# Altium project POD-Design-v1.1.PrjPcb (part 4 of 6)

## Sheet Motion-Temp-Sensor-Sheet.SchDoc
size 420 x 297 mm; SheetNumber: 6; SheetTotal: 11
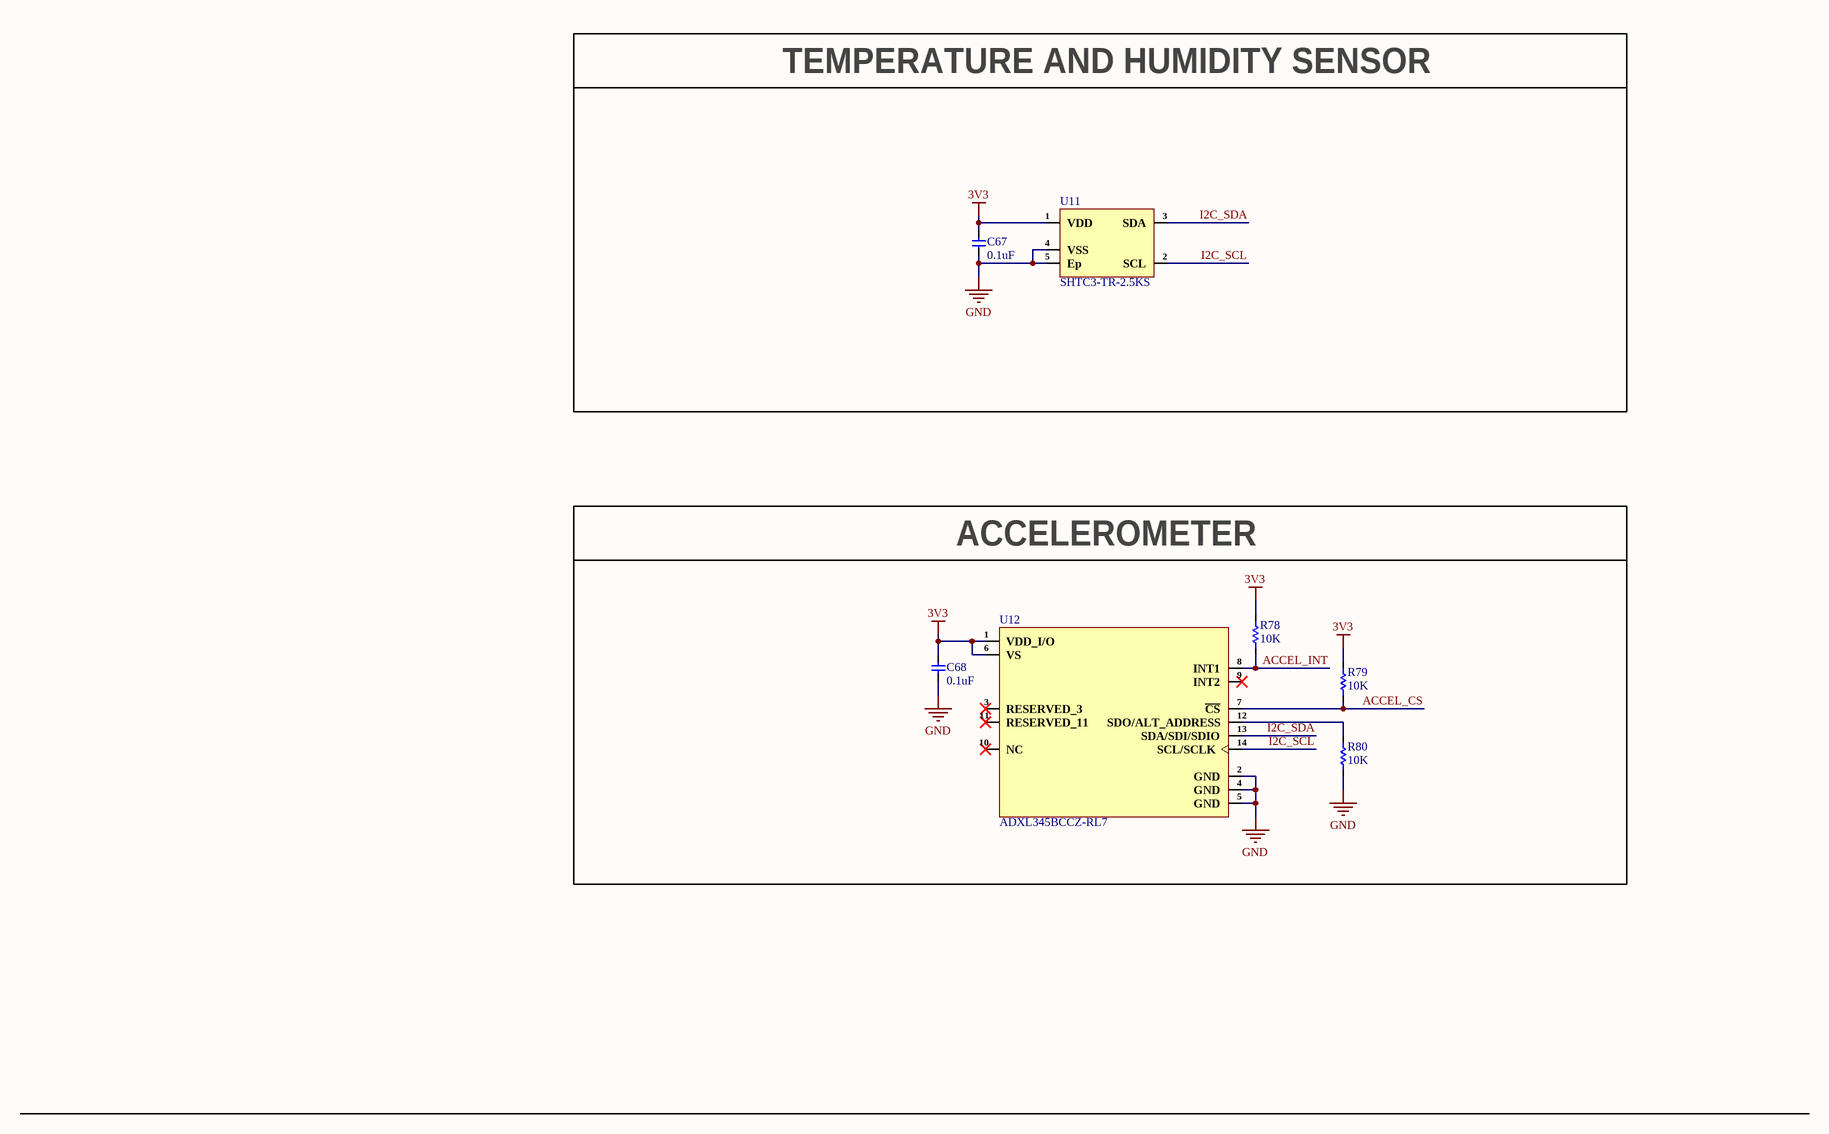
[diagram p5: Motion-Temp-Sensor-Sheet.SchDoc]

### Parts
C67  0.1uF  [Cap-0402]
C68  0.1uF  [Cap-0402]
R78  10K  [Res-0402]
R79  10K  [Res-0402]
R80  10K  [Res-0402]
U11  SHTC3-TR-2.5KS  [4-WDFN Exposed Pad]
U12  ADXL345BCCZ-RL7  [14-LGA (3x5)]

### Blocks framed on the sheet
TEMPERATURE AND HUMIDITY SENSOR: C67 U11
ACCELEROMETER: C68 R78-R80 U12

### Nets
3V3: C67.2 C68.1 R78.2 R79.2 U11.1(VDD) U12.1(VDD_I/O) U12.6(VS)
GND: C67.1 C68.2 R80.1 U11.4(VSS) U11.5(Ep) U12.2(GND) U12.4(GND) U12.5(GND)
ACCEL_CS: R79.1 U12.7(~{CS})
ACCEL_INT: R78.1 U12.8(INT1)
I2C_SCL: U11.2(SCL) U12.14(SCL/SCLK)
I2C_SDA: U11.3(SDA) U12.13(SDA/SDI/SDIO)
NetR80_2: R80.2 U12.12(SDO/ALT_ADDRESS)

Not connected (* = marked no-connect by the designer): U12 3(RESERVED_3)* 9(INT2)* 10(NC)* 11(RESERVED_11)*

### Notes on the sheet
- ZyntelliTech
- File:
- Title:
- Date:
- Page
- Num:
- Total:
- Drawn By: Huzaifa Ali

### Library data of the parts
C67 = CC0402KRX7R7BB104: CAP CER 0.1UF 16V X7R 0402; Manufacturer: Yageo; Item Type: Capacitors; Material: 4241ConductorMaterial; Tolerance: 10%; Value: 100nF; Temperature Coefficient: 30ppm/°C; Supplier: Future Electronics; LCSC Part Number: C60474; Manufacturer Part Number: CC0402KRX7R7BB104; RoHS: Yes; Stock: 22130000; Pricing: 10000=0.0021, 40000=0.002, 150000=0.0019, 250000=0.0019, 500000=0.0018 (USD); Mounting Technology: Surface Mount; Case/Package: 0402; Pins: 2; Case Code (Metric): 1005; Case Code (Imperial): 0402; Min Operating Temperature: -55°C; Max Operating Temperature: 125°C; Dielectric: X7R; Voltage Rating: 16V; Voltage Rating (DC): 16V; Packaging: Tape and Reel; Package Quantity: 1; Termination: SMD/SMT; Voltage: 16V; Series: CC; Voltage Rating (AC): 16V; Length: 1mm; Width: 0.02inch; Height: 0.5mm; Thickness: 0.022inch; Depth: 0.5mm; Radiation Hardening: No; RoHS Compliant: Yes; Reach SVHC Compliant: No; Halogen Free: 5694HalogenFree; Lead Free: 5697LeadFree; ComponentLink1URL: https://datasheet.ciiva.com/11788/0900766b80ce67ed-11788364.pdf?src-supplier=Rs; ComponentLink1Description: https://datasheet.ciiva.com/11788/0900766b80ce67ed-11788364.pdf?src-supplier=Rs; ComponentLink2URL: https://datasheet.ciiva.com/7978/1489800-7978111.pdf?src-supplier=Element14; ComponentLink2Description: https://datasheet.ciiva.com/7978/1489800-7978111.pdf?src-supplier=Element14; ComponentLink3URL: https://datasheet.ciiva.com/161/mlccorderingcode-161545.pdf?src-supplier=Digikey; ComponentLink3Description: https://datasheet.ciiva.com/161/mlccorderingcode-161545.pdf?src-supplier=Digikey; ComponentLink4URL: https://datasheet.ciiva.com/161/mlccorderingcode-161544.pdf?src-supplier=Digikey; ComponentLink4Description: https://datasheet.ciiva.com/161/mlccorderingcode-161544.pdf?src-supplier=Digikey; ComponentLink5URL: https://datasheet.ciiva.com/161/mlccorderingcode-161546.pdf?src-supplier=Digikey; ComponentLink5Description: https://datasheet.ciiva.com/161/mlccorderingcode-161546.pdf?src-supplier=Digikey; ComponentLink6URL: https://datasheet.ciiva.com/8033/1734573-8033661.pdf?src-supplier=Element14; ComponentLink6Description: https://datasheet.ciiva.com/8033/1734573-8033661.pdf?src-supplier=Element14; ComponentLink7URL: https://datasheet.ciiva.com/28450/1489800-28450335.pdf?src-supplier=Element14; ComponentLink7Description: https://datasheet.ciiva.com/28450/1489800-28450335.pdf?src-supplier=Element14; ComponentLink8URL: https://datasheet.ciiva.com/13395/upy-gphc-x7r-6-3v-to-50v-8-13395676.pdf?src-supplier=Mouser; ComponentLink8Description: https://datasheet.ciiva.com/13395/upy-gphc-x7r-6-3v-to-50v-8-13395676.pdf?src-supplier=Mouser; ComponentLink9URL: https://datasheet.ciiva.com/8033/1734573-8033663.pdf?src-supplier=Element14; ComponentLink9Description: https://datasheet.ciiva.com/8033/1734573-8033663.pdf?src-supplier=Element14; ComponentLink10URL: https://datasheet.ciiva.com/11587/upy-gphc-x7r-6-3v-to-50v-8-11587305.pdf?src-supplier=Avnet; ComponentLink10Description: https://datasheet.ciiva.com/11587/upy-gphc-x7r-6-3v-to-50v-8-11587305.pdf?src-supplier=Avnet
C68 = CC0402JRX7R7BB104: CAP CER 0.1UF 16V X7R 0402; Manufacturer: Yageo; Material: 4241ConductorMaterial; Value: 100nF; Tolerance: 5%; Item Type: Capacitor; Supplier: Digikey; Supplier Part Number: 311-1676-1-ND; Manufacturer Part Number: CC0402JRX7R7BB104; RoHS: Yes; Category: Ceramic Capacitors; Stock: 1659111; Pricing: 1=0.1, 10=0.046, 50=0.0262, 100=0.0203, 500=0.01528, 1000=0.012, 2500=0.01091, 5000=0.01004 (USD); Mounting Technology: Surface Mount; Case/Package: 0402; Case Code (Metric): 1005; Case Code (Imperial): 0402; Min Operating Temperature: -55°C; Max Operating Temperature: 125°C; Dielectric: X7R; Packaging: Tape and Reel; Package Quantity: 10000; Voltage Rating (DC): 16V; Voltage Rating: 16V; Series: CC; Construction: Flat; Length: 0.039inch; Width: 0.02inch; Height: 0.5mm; Thickness: 0.022inch; Lead Free: Lead Free; Halogen Free: Halogen Free; RoHS Compliant: Yes; ComponentLink1URL: https://datasheet.ciiva.com/13210/upy-gphc-x7r-6-3v-to-50v-8-12304-13210152.pdf?src-supplier=Mouser; ComponentLink1Description: https://datasheet.ciiva.com/13210/upy-gphc-x7r-6-3v-to-50v-8-12304-13210152.pdf?src-supplier=Mouser; LCSC Part Number: C541464
R78-R80 = RC0402FR-0710KL: RES 10K OHM 1% 1/16W 0402; Manufacturer: Yageo; Resistance: 10kR; Voltage Rating (DC): 50V; Temperature Coefficient: 100ppm/°C; Power Rating: 62.5mW; Max Power Dissipation: 63mW; Item Type: Resistor; Supplier 1: Mouser; Manufacturer Part Number: RC0402FR-0710KL; RoHS: Yes; Category: Chip SMD Resistors; Stock 1: 18648329; Pricing 1: 1=0.10000, 10=0.01400, 50=0.01400, 100=0.00500, 1000=0.00300, 10000=0.00200 (USD); Case/Package: 0402; Number of Pins: 2; Case Code (Imperial): 0402; Case Code (Metric): 1005; Min Operating Temperature: -55°C; Max Operating Temperature: 155°C; Resistor Type: Thick Film; Tolerance: 1%; Packaging: Tape and Reel; Voltage Rating: 50V; Termination: SMD/SMT; Working Voltage: 50V; Number of Terminations: 2; Features: Moisture Resistant; Series: RC; Resistance Tolerance: 1%; Construction: Rectangular; Length: 1mm; Width: 0.5mm; Height: 0.32mm; Depth: 0.5mm; Lead Pitch: 0.2mm; REACH SVHC: No SVHC; Lead Free: Lead Free; RoHS Compliant: Yes; Military Standard: Not; ComponentLink1URL: https://datasheet.ciiva.com/7660/38568-7660787.pdf?src-supplier=Element14; ComponentLink1Description: https://datasheet.ciiva.com/7660/38568-7660787.pdf?src-supplier=Element14; ComponentLink2URL: https://datasheet.ciiva.com/7849/1686128-7849814.pdf?src-supplier=Element14; ComponentLink2Description: https://datasheet.ciiva.com/7849/1686128-7849814.pdf?src-supplier=Element14; ComponentLink3URL: https://datasheet.ciiva.com/7983/1018594-7983486.pdf?src-supplier=Element14; ComponentLink3Description: https://datasheet.ciiva.com/7983/1018594-7983486.pdf?src-supplier=Element14; ComponentLink4URL: https://datasheet.ciiva.com/22747/1018594-22747512.pdf?src-supplier=Element14; ComponentLink4Description: https://datasheet.ciiva.com/22747/1018594-22747512.pdf?src-supplier=Element14; ComponentLink5URL: https://datasheet.ciiva.com/12667/pyu-rc0402-51-rohs-l-6-r-12667067.pdf?src-supplier=Mouser; ComponentLink5Description: https://datasheet.ciiva.com/12667/pyu-rc0402-51-rohs-l-6-r-12667067.pdf?src-supplier=Mouser; ComponentLink6URL: https://datasheet.ciiva.com/7849/1784430-7849813.pdf?src-supplier=Element14; ComponentLink6Description: https://datasheet.ciiva.com/7849/1784430-7849813.pdf?src-supplier=Element14; ComponentLink7URL: https://datasheet.ciiva.com/7849/1784430-7849815.pdf?src-supplier=Element14; ComponentLink7Description: https://datasheet.ciiva.com/7849/1784430-7849815.pdf?src-supplier=Element14; Supplier Part Number 1: 603-RC0402FR-0710KL; LCSC Part Number: C60490
U11 = SHTC3-TR-2.5KS: SHTC3 Series Digital ±2% RH SMT Humidity Temperature Sensor - DFN-8; Manufacturer: Sensirion; Item Type: IC; Supplier: Digikey; LCSC Part Number: C194656; Manufacturer Part Number: SHTC3-TR-2.5KS; RoHS: No; Stock: 21685; Pricing: 1=2.72, 5=2.292, 10=2.129, 25=1.932, 50=1.7952, 100=1.6682, 500=1.40712, 1000=1.30776 (USD); ComponentLink1URL: https://datasheet.octopart.com/SHTC3-TR-2.5KS-Sensirion-datasheet-166628637.pdf?src-supplier=Future+Electronics; ComponentLink1Description: https://datasheet.octopart.com/SHTC3-TR-2.5KS-Sensirion-datasheet-166628637.pdf?src-supplier=Future+Electronics
U12 = ADXL345BCCZ-RL7: ACCEL 2-16G I2C/SPI 14LGA; Manufacturer: Analog Devices; Item Type: Accelerometers; Supplier: Mouser; LCSC Part Number: C9667; Manufacturer Part Number: ADXL345BCCZ-RL7; RoHS: Yes; Stock: 17836; Pricing: 1=6.67, 10=5.76, 50=5.27, 100=5.09, 1000=4.59, 10000=4.59 (USD); ComponentLink1URL: https://datasheet.ciiva.com/15099/getdatasheetpartid-317342-15099703.pdf?src-supplier=Verical; ComponentLink1Description: https://datasheet.ciiva.com/15099/getdatasheetpartid-317342-15099703.pdf?src-supplier=Verical; ComponentLink2URL: https://datasheet.ciiva.com/3271/adxl345-ep-3271528.pdf?src-supplier=Avnet; ComponentLink2Description: https://datasheet.ciiva.com/3271/adxl345-ep-3271528.pdf?src-supplier=Avnet; ComponentLink3URL: https://datasheet.ciiva.com/2809/adxl345-2809853.pdf?src-supplier=Digikey; ComponentLink3Description: https://datasheet.ciiva.com/2809/adxl345-2809853.pdf?src-supplier=Digikey; ComponentLink4URL: https://datasheet.ciiva.com/2809/adxl345-2809854.pdf?src-supplier=Digikey; ComponentLink4Description: https://datasheet.ciiva.com/2809/adxl345-2809854.pdf?src-supplier=Digikey; ComponentLink5URL: https://datasheet.ciiva.com/2809/adxl345-2809855.pdf?src-supplier=Digikey; ComponentLink5Description: https://datasheet.ciiva.com/2809/adxl345-2809855.pdf?src-supplier=Digikey; ComponentLink6URL: https://datasheet.ciiva.com/3271/adxl345-ep-3271595.pdf?src-supplier=Avnet; ComponentLink6Description: https://datasheet.ciiva.com/3271/adxl345-ep-3271595.pdf?src-supplier=Avnet

## Sheet DC-Measurement-Sheet.SchDoc
size 420 x 297 mm; SheetNumber: 7; SheetTotal: 11
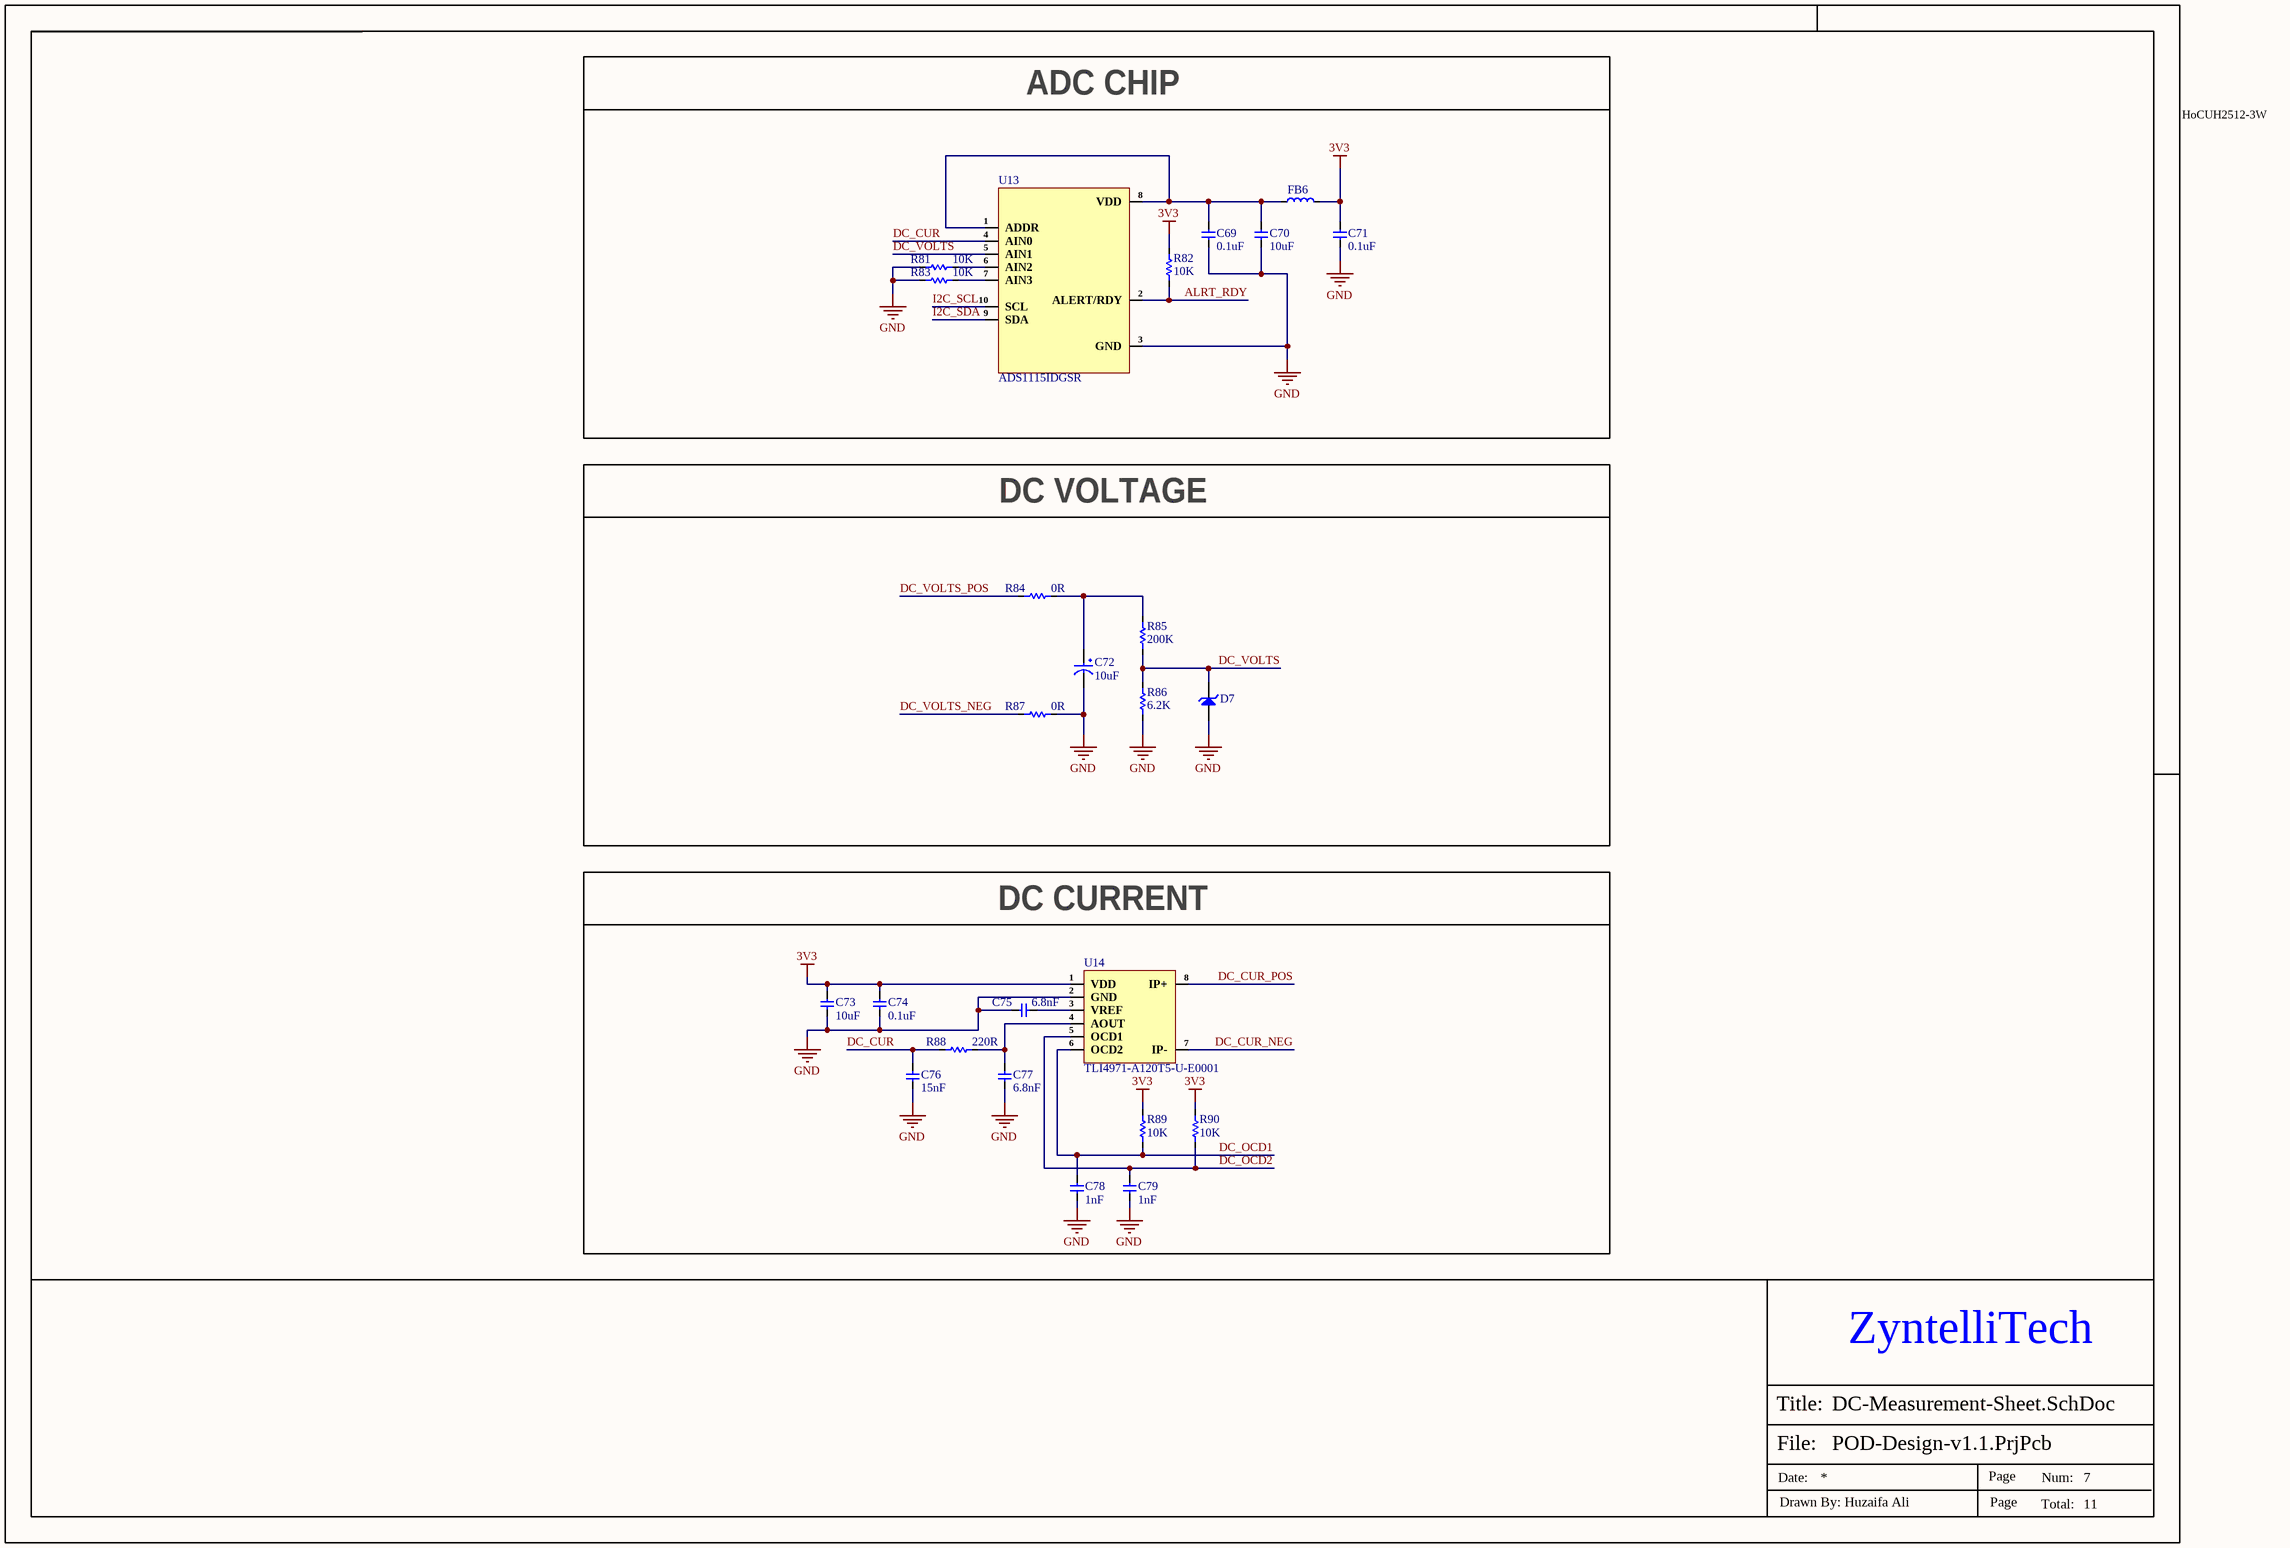
[diagram p6: DC-Measurement-Sheet.SchDoc]

### Parts
C69  0.1uF  [Cap-0402]
C70  10uF  [Cap-0603]
C71  0.1uF  [Cap-0402]
C72  10uF  [UD2C100M0810]
C73  10uF  [Cap-0603]
C74  0.1uF  [Cap-0603]
C75  6.8nF  [Cap-0603]
C76  15nF  [Cap-0603]
C77  6.8nF  [Cap-0603]
C78  1nF  [Cap-0402]
C79  1nF  [Cap-0402]
D7  MM3Z3V3B  [SOD323F]  (value not drawn)
FB6  MMZ2012R102ATD25  [Ind-0805]  (value not drawn)
R81  10K  [Res-0402]
R82  10K  [Res-0402]
R83  10K  [Res-0402]
R84  0R  [Res-0805]
R85  200K  [RES-2512]
R86  6.2K  [RES-2512]
R87  0R  [Res-0805]
R88  220R  [Res-0603]
R89  10K  [Res-0402]
R90  10K  [Res-0402]
U13  ADS1115IDGSR  [VSSOP-10]
U14  TLI4971-A120T5-U-E0001  [TISON-8(8x8)]

### Blocks framed on the sheet
ADC CHIP: C69-C71 FB6 R81-R83 U13
DC VOLTAGE: C72 D7 R84-R87
DC CURRENT: C73-C79 R88-R90 U14

### Nets
3V3: C71.2 C73.2 C74.2 FB6.2 R82.2 R89.1 R90.1 U14.1(VDD)
GND: C69.1 C70.1 C71.1 C72.2 C73.1 C74.1 C75.1 C76.1 C77.1 C78.1 C79.1 D7.1(A) R81.1 R83.1 R86.1 R87.2 U13.3(GND) U14.2(GND)
ALRT_RDY: R82.1 U13.2(ALERT/RDY)
DC_CUR: C76.2 R88.1 U13.4(AIN0)
DC_CUR_NEG: U14.7(IP-)
DC_CUR_POS: U14.8(IP+)
DC_OCD1: C78.2 R89.2 U14.6(OCD2)
DC_OCD2: C79.2 R90.2 U14.5(OCD1)
DC_VOLTS: D7.2(K) R85.1 R86.2 U13.5(AIN1)
DC_VOLTS_NEG: R87.1
DC_VOLTS_POS: R84.1
I2C_SCL: U13.10(SCL)
I2C_SDA: U13.9(SDA)
NetC69_2: C69.2 C70.2 FB6.1 U13.1(ADDR) U13.8(VDD)
NetC72_1: C72.1 R84.2 R85.2
NetC75_2: C75.2 U14.3(VREF)
NetC77_2: C77.2 R88.2 U14.4(AOUT)
NetR81_2: R81.2 U13.6(AIN2)
NetR83_2: R83.2 U13.7(AIN3)

### Notes on the sheet
- HoCUH2512-3W
- ZyntelliTech
- File:
- Title:
- Date:
- Page
- Num:
- Total:
- Drawn By: Huzaifa Ali

### Library data of the parts
C69 C71 = CC0402KRX7R7BB104: as C67 on sheet Motion-Temp-Sensor-Sheet; Supplier: Future Electronics; LCSC Part Number: C60474; Manufacturer Part Number: CC0402KRX7R7BB104; RoHS: Yes; Stock: 22130000; Pricing: 10000=0.0021, 40000=0.002, 150000=0.0019, 250000=0.0019, 500000=0.0018 (USD); Mounting Technology: Surface Mount; Case/Package: 0402; Pins: 2; Case Code (Metric): 1005; Case Code (Imperial): 0402; Min Operating Temperature: -55°C; Max Operating Temperature: 125°C; Dielectric: X7R; Voltage Rating: 16V; Voltage Rating (DC): 16V; Packaging: Tape and Reel; Package Quantity: 1; Termination: SMD/SMT; Voltage: 16V; Series: CC; Voltage Rating (AC): 16V; Length: 1mm; Width: 0.02inch; Height: 0.5mm; Thickness: 0.022inch; Depth: 0.5mm; Radiation Hardening: No; RoHS Compliant: Yes; Reach SVHC Compliant: No; Halogen Free: 5694HalogenFree; Lead Free: 5697LeadFree; ComponentLink1URL: https://datasheet.ciiva.com/11788/0900766b80ce67ed-11788364.pdf?src-supplier=Rs; ComponentLink1Description: https://datasheet.ciiva.com/11788/0900766b80ce67ed-11788364.pdf?src-supplier=Rs; ComponentLink2URL: https://datasheet.ciiva.com/7978/1489800-7978111.pdf?src-supplier=Element14; ComponentLink2Description: https://datasheet.ciiva.com/7978/1489800-7978111.pdf?src-supplier=Element14; ComponentLink3URL: https://datasheet.ciiva.com/161/mlccorderingcode-161545.pdf?src-supplier=Digikey; ComponentLink3Description: https://datasheet.ciiva.com/161/mlccorderingcode-161545.pdf?src-supplier=Digikey; ComponentLink4URL: https://datasheet.ciiva.com/161/mlccorderingcode-161544.pdf?src-supplier=Digikey; ComponentLink4Description: https://datasheet.ciiva.com/161/mlccorderingcode-161544.pdf?src-supplier=Digikey; ComponentLink5URL: https://datasheet.ciiva.com/161/mlccorderingcode-161546.pdf?src-supplier=Digikey; ComponentLink5Description: https://datasheet.ciiva.com/161/mlccorderingcode-161546.pdf?src-supplier=Digikey; ComponentLink6URL: https://datasheet.ciiva.com/8033/1734573-8033661.pdf?src-supplier=Element14; ComponentLink6Description: https://datasheet.ciiva.com/8033/1734573-8033661.pdf?src-supplier=Element14; ComponentLink7URL: https://datasheet.ciiva.com/28450/1489800-28450335.pdf?src-supplier=Element14; ComponentLink7Description: https://datasheet.ciiva.com/28450/1489800-28450335.pdf?src-supplier=Element14; ComponentLink8URL: https://datasheet.ciiva.com/13395/upy-gphc-x7r-6-3v-to-50v-8-13395676.pdf?src-supplier=Mouser; ComponentLink8Description: https://datasheet.ciiva.com/13395/upy-gphc-x7r-6-3v-to-50v-8-13395676.pdf?src-supplier=Mouser; ComponentLink9URL: https://datasheet.ciiva.com/8033/1734573-8033663.pdf?src-supplier=Element14; ComponentLink9Description: https://datasheet.ciiva.com/8033/1734573-8033663.pdf?src-supplier=Element14; ComponentLink10URL: https://datasheet.ciiva.com/11587/upy-gphc-x7r-6-3v-to-50v-8-11587305.pdf?src-supplier=Avnet; ComponentLink10Description: https://datasheet.ciiva.com/11587/upy-gphc-x7r-6-3v-to-50v-8-11587305.pdf?src-supplier=Avnet
C70 C73 = GRM188Z71A106KA73D: CAP CER 10UF 10V X7R 0603; Manufacturer: Murata; Item Type: Capacitor; Material: 4241ConductorMaterial; Tolerance: 10%; Supplier: Mouser; LCSC Part Number: C2959727; Manufacturer Part Number: GRM188Z71A106KA73D; RoHS: Yes; Stock: 390983; Pricing: 1=0.36, 10=0.155, 50=0.155, 100=0.104, 1000=0.094, 10000=0.065 (USD); Case/Package: 345Case; Min Operating Temperature: -55°C; Max Operating Temperature: 125°C; Value: 10uF; Voltage Rating: 10V; Length: 1.6mm; Width: 800um; Height: 1mm; Thickness: 800um; RoHS Compliant: Yes; ComponentLink1URL: https://datasheet.octopart.com/GRM188Z71A106KA73D-Murata-datasheet-165579666.pdf?src-supplier=TME; ComponentLink1Description: https://datasheet.octopart.com/GRM188Z71A106KA73D-Murata-datasheet-165579666.pdf?src-supplier=TME
C72 = UD2C100M0810: 10uF 160V ±20% SMD,D8xL10.2mm Aluminum Electrolytic Capacitors - SMD ROHS; Manufacturer: Honor Elec; Manufacturer Part Number: UD2C100M0810; Package: SMD,D8xL10.2mm; LCSC Part Number: C88696; Item Type: Capacitor; ComponentLink1Description: LCSC; ComponentLink1URL: https://www.lcsc.com/product-detail/Aluminum-Electrolytic-Capacitors-SMD_Honor-Elec-UD2C100M0810_C88696.html
C74 = CC0603JRX7R9BB104: CAP CER 0.1UF 50V X7R 0603; Manufacturer: Yageo; Item Type: Capacitors; Material: 4241ConductorMaterial; Supplier: Future Electronics; LCSC Part Number: C91183; Manufacturer Part Number: CC0603JRX7R9BB104; RoHS: Yes; Stock: 204000; Pricing: 4000=0.0077, 16000=0.0073, 60000=0.007, 160000=0.0068, 400000=0.0064 (USD); Pins: 2NUMBER; Halogen Free: 5694HalogenFree; Lead Free: 5697LeadFree; ComponentLink1URL: https://datasheet.ciiva.com/11465/upy-gphc-x7r-6-3v-to-50v-8-11465038.pdf?src-supplier=Avnet; ComponentLink1Description: https://datasheet.ciiva.com/11465/upy-gphc-x7r-6-3v-to-50v-8-11465038.pdf?src-supplier=Avnet
C75 C77 = 0603B682K500NT: 50V 6.8nF X7R ±10% 0603; Manufacturer: FH; Item Type: Capacitor; ComponentLink1Description: LCSC; ComponentLink1URL: https://www.lcsc.com/product-detail/Multilayer-Ceramic-Capacitors-MLCC-SMD-SMT_FH-Guangdong-Fenghua-Advanced-Tech-0603B682K500NT_C1631.html; Manufacturer Part Number: 0603B682K500NT; Value: 6.8nF; LCSC Part Number: C1631; Footprint: 0603
C76 = CC0603JRX7R9BB153: CAP CER 0.015UF 50V X7R 0603; Manufacturer: Yageo; Tolerance: 5%; Item Type: Capacitor; Supplier 1: Future Electronics; Manufacturer Part Number: CC0603JRX7R9BB153; RoHS: Yes; Category: Ceramic Capacitors; Stock 1: 16000; Pricing 1: 4000=0.00980, 16000=0.00930, 60000=0.00890, 100000=0.00870, 200000=0.00820 (USD); Mounting Technology: Surface Mount; Case/Package: 0603; Case Code (Imperial): 0603; Case Code (Metric): 1608; Weight: 7.1E-05oz; Min Operating Temperature: -55°C; Max Operating Temperature: 125°C; Value: 15nF; Dielectric: X7R; Voltage Rating: 50V; Voltage Rating (DC): 50V; Packaging: Tape and Reel; Termination: SMD/SMT; Resistor Type: Ceramic; Series: CC; Construction: Flat; Length: 1.6mm; Width: 0.031inch; Height: 0.8mm; Thickness: 0.035inch; Depth: 0.8mm; Radiation Hardening: No; Lead Free: Lead Free; Halogen Free: Halogen Free; RoHS Compliant: Yes; ComponentLink1URL: http://www.mouser.com/ds/2/447/Yageo_UPY-GP_NP0_16V-to-50V_9-358835.pdf?src-supplier=Mouser; ComponentLink1Description: http://www.mouser.com/ds/2/447/Yageo_UPY-GP_NP0_16V-to-50V_9-358835.pdf?src-supplier=Mouser; ComponentLink2URL: https://www.yageo.com/upload/media/product/productsearch/datasheet/mlcc/UPY-GPHC_X7R_6.3V-to-50V_18.pdf?src-supplier=Digi-Key; ComponentLink2Description: https://www.yageo.com/upload/media/product/productsearch/datasheet/mlcc/UPY-GPHC_X7R_6.3V-to-50V_18.pdf?src-supplier=Digi-Key; ComponentLink3URL: http://www.yageo.com/documents/recent/UPY-GPHC_X7R_6.3V-to-50V_8.pdf?src-supplier=Avnet; ComponentLink3Description: http://www.yageo.com/documents/recent/UPY-GPHC_X7R_6.3V-to-50V_8.pdf?src-supplier=Avnet; ComponentLink4URL: http://www.yageo.com/documents/recent/UPY-GPHC_X7R_6.3V-to-50V_9.pdf?src-supplier=Future+Electronics; ComponentLink4Description: http://www.yageo.com/documents/recent/UPY-GPHC_X7R_6.3V-to-50V_9.pdf?src-supplier=Future+Electronics; ComponentLink5URL: http://www.yageo.com/documents/recent/UPY-GPHC_X7R_6.3V-to-50V_16.pdf?src-supplier=Digi-Key; ComponentLink5Description: http://www.yageo.com/documents/recent/UPY-GPHC_X7R_6.3V-to-50V_16.pdf?src-supplier=Digi-Key; Supplier Part Number 1: 8958167; LCSC Part Number: C519550
C78 C79 = CC0402KRX7R8BB102: CAP CER 1000PF 25V X7R 0402; Manufacturer: Yageo; Tolerance: 10%; Dissipation Factor: 2.5%; Insulation Resistance: 10GR; Item Type: Capacitor; Supplier 1: Arrow Electronics; Manufacturer Part Number: CC0402KRX7R8BB102; RoHS: Yes; Category: Ceramic Capacitors; Stock 1: 370000; Pricing 1: 1=0.00230, 10000=0.00230, 100001=0.00190 (USD); Mount: Surface Mount; Case/Package: 0402; Number of Pins: 2; Case Code (Imperial): 0402; Case Code (Metric): 1005; Min Operating Temperature: -55°C; Max Operating Temperature: 125°C; Capacitance: 1nF; Packaging: Tape and Reel; Voltage Rating: 25V; Dielectric: X7R; Termination: SMD/SMT; Voltage Rating (DC): 25V; Series: CC; Length: 1mm; Width: 0.02inch; Thickness: 0.022inch; Depth: 0.5mm; Radiation Hardening: No; Lead Free: Lead Free; Halogen Free: Halogen Free; RoHS Compliant: Yes; ComponentLink1URL: https://datasheet.ciiva.com/26862/getdatasheetpartid-639817-26862638.pdf?src-supplier=Verical; ComponentLink1Description: https://datasheet.ciiva.com/26862/getdatasheetpartid-639817-26862638.pdf?src-supplier=Verical; ComponentLink2URL: https://datasheet.ciiva.com/5425/upy-gp-np0-16v-to-50v-8-3714-5425527.pdf?src-supplier=Mouser; ComponentLink2Description: https://datasheet.ciiva.com/5425/upy-gp-np0-16v-to-50v-8-3714-5425527.pdf?src-supplier=Mouser; Supplier Part Number 1: CC0402KRX7R8BB102; LCSC Part Number: C541372
D7 = MM3Z3V3B: DIODE ZENER 3.3V 200MW SOD323F; Manufacturer: ON Semiconductor / Fairchild; Forward Voltage: 1V; Tolerance: 2%; Impedance: 89R; Max Reverse Leakage Current: 4.5uA; Test Current: 5mA; Element Configuration: Single; Supplier 1: Digi-Key; Manufacturer Part Number: MM3Z3V3B; Stock 1: 473644; Pricing 1: 1=0.22, 10=0.18, 100=0.0956, 500=0.06288, 1000=0.04276 (USD); Mount: Surface Mount; Number of Pins: 2; Weight: 0.0276g; Min Operating Temperature: -65°C; Max Operating Temperature: 150°C; Packaging: Tape and Reel; Package Quantity: 1; Max Power Dissipation: 200mW; Zener Voltage: 3.3V; Voltage Tolerance: 2%; Power Dissipation: 200mW; Working Voltage: 3.3V; Peak Reverse Current: 4.5uA; Length: 1.3mm; Height: 1mm; Width: 1.7mm; Radiation Hardening: No; REACH SVHC: No SVHC; Lead Free: Lead Free; ComponentLink1URL: http://www.onsemi.com/pub/Collateral/MM3Z9V1B-D.pdf?src-supplier=Digi-Key; ComponentLink1Description: http://www.onsemi.com/pub/Collateral/MM3Z9V1B-D.pdf?src-supplier=Digi-Key; ComponentLink2URL: http://www.mouser.com/ds/2/149/MM3Z3V3B-187166.pdf?src-supplier=Mouser; ComponentLink2Description: http://www.mouser.com/ds/2/149/MM3Z3V3B-187166.pdf?src-supplier=Mouser; ComponentLink3URL: https://www.fairchildsemi.com/datasheets/MM/MM3Z9V1B.pdf?src-supplier=Avnet; ComponentLink3Description: https://www.fairchildsemi.com/datasheets/MM/MM3Z9V1B.pdf?src-supplier=Avnet; ComponentLink4URL: http://www.farnell.com/datasheets/1706525.pdf?src-supplier=Element14; ComponentLink4Description: http://www.farnell.com/datasheets/1706525.pdf?src-supplier=Element14; Supplier Part Number 1: MM3Z3V3BCT-ND; LCSC Part Number: C2978865; Item Type: Diode
FB6 = MMZ2012R102ATD25: FERRITE BEAD 1K OHM 0805 1LN; Manufacturer: TDK; Number of Lines: 1; Max Current Rating: 500mA; DC Resistance (DCR): 300mR; Impedance: 1kR; Tolerance: 25%; Test Frequency: 100MHz; Supplier 1: Digi-Key; Manufacturer Part Number: MMZ2012R102ATD25; RoHS: Yes; Category: Ferrite Beads and Chips; Stock 1: 2942; Pricing 1: 1=0.11000, 10=0.09200, 25=0.08280, 50=0.06080, 100=0.05240, 250=0.04140, 500=0.03496, 1000=0.02944 (USD); Mount: Surface Mount; Case/Package: 0805; Case Code (Metric): 2012; Case Code (Imperial): 0805; Weight: 0.000194oz; Min Operating Temperature: -55°C; Max Operating Temperature: 125°C; Package Quantity: 4000; Packaging: Tape and Reel; Termination: SMD/SMT; Max DC Current: 500mA; Length: 0.079inch; Width: 0.049inch; Height: 0.041inch; Ratings: AEC-Q200; RoHS Compliant: Yes; ComponentLink1URL: http://www.mouser.com/ds/2/400/beads_automotive_signal_mmz_en-469244.pdf?src-supplier=Mouser; ComponentLink1Description: http://www.mouser.com/ds/2/400/beads_automotive_signal_mmz_en-469244.pdf?src-supplier=Mouser; ComponentLink2URL: https://product.tdk.com/info/en/catalog/datasheets/beads_automotive_signal_mmz2012_en.pdf?src-supplier=Digi-Key; ComponentLink2Description: https://product.tdk.com/info/en/catalog/datasheets/beads_automotive_signal_mmz2012_en.pdf?src-supplier=Digi-Key; Supplier Part Number 1: 445-MMZ2012R102ATD25CT-ND; LCSC Part Number: C307765; Item Type: Ferrite Bead
R81-R83 = RC0402FR-0710KL: as R78 on sheet Motion-Temp-Sensor-Sheet; Supplier 1: Mouser; Manufacturer Part Number: RC0402FR-0710KL; RoHS: Yes; Category: Chip SMD Resistors; Stock 1: 18648329; Pricing 1: 1=0.10000, 10=0.01400, 50=0.01400, 100=0.00500, 1000=0.00300, 10000=0.00200 (USD); Case/Package: 0402; Number of Pins: 2; Case Code (Imperial): 0402; Case Code (Metric): 1005; Min Operating Temperature: -55°C; Max Operating Temperature: 155°C; Resistor Type: Thick Film; Tolerance: 1%; Packaging: Tape and Reel; Voltage Rating: 50V; Termination: SMD/SMT; Working Voltage: 50V; Number of Terminations: 2; Features: Moisture Resistant; Series: RC; Resistance Tolerance: 1%; Construction: Rectangular; Length: 1mm; Width: 0.5mm; Height: 0.32mm; Depth: 0.5mm; Lead Pitch: 0.2mm; REACH SVHC: No SVHC; Lead Free: Lead Free; RoHS Compliant: Yes; Military Standard: Not; ComponentLink1URL: https://datasheet.ciiva.com/7660/38568-7660787.pdf?src-supplier=Element14; ComponentLink1Description: https://datasheet.ciiva.com/7660/38568-7660787.pdf?src-supplier=Element14; ComponentLink2URL: https://datasheet.ciiva.com/7849/1686128-7849814.pdf?src-supplier=Element14; ComponentLink2Description: https://datasheet.ciiva.com/7849/1686128-7849814.pdf?src-supplier=Element14; ComponentLink3URL: https://datasheet.ciiva.com/7983/1018594-7983486.pdf?src-supplier=Element14; ComponentLink3Description: https://datasheet.ciiva.com/7983/1018594-7983486.pdf?src-supplier=Element14; ComponentLink4URL: https://datasheet.ciiva.com/22747/1018594-22747512.pdf?src-supplier=Element14; ComponentLink4Description: https://datasheet.ciiva.com/22747/1018594-22747512.pdf?src-supplier=Element14; ComponentLink5URL: https://datasheet.ciiva.com/12667/pyu-rc0402-51-rohs-l-6-r-12667067.pdf?src-supplier=Mouser; ComponentLink5Description: https://datasheet.ciiva.com/12667/pyu-rc0402-51-rohs-l-6-r-12667067.pdf?src-supplier=Mouser; ComponentLink6URL: https://datasheet.ciiva.com/7849/1784430-7849813.pdf?src-supplier=Element14; ComponentLink6Description: https://datasheet.ciiva.com/7849/1784430-7849813.pdf?src-supplier=Element14; ComponentLink7URL: https://datasheet.ciiva.com/7849/1784430-7849815.pdf?src-supplier=Element14; ComponentLink7Description: https://datasheet.ciiva.com/7849/1784430-7849815.pdf?src-supplier=Element14; Supplier Part Number 1: 603-RC0402FR-0710KL; LCSC Part Number: C60490
R84 R87 = RC0805FR-070RL: RES 0 OHM JUMPER 1/8W 0805; Manufacturer: Yageo; Resistance: 0mR; Tolerance: 1%; Power Rating: 125mW; Item Type: Resistor; Supplier 1: Avnet; Manufacturer Part Number: RC0805FR-070RL; RoHS: Yes; Category: Chip SMD Resistors; Stock 1: 85000; Pricing 1: 5000=0.00281, 10000=0.00277, 20000=0.00269 (USD); Case/Package: 0805; Contact Plating: Tin,Matte; Case Code (Imperial): 0805; Case Code (Metric): 2012; Size Code: 0805; Min Operating Temperature: -55°C; Max Operating Temperature: 155°C; Resistor Type: Thick Film; Packaging: Tape and Reel; Features: Moisture Resistant; Series: RC; Max Power Dissipation: 125mW; Number of Terminations: 2; Construction: Rectangular; Length: 2mm; Depth: 1.25mm; Radiation Hardening: No; Military Standard: Not; Lead Free: Lead Free; RoHS Compliant: Yes; ComponentLink1URL: https://datasheet.ciiva.com/15189/getdatasheetpartid-348154-15189885.pdf?src-supplier=Verical; ComponentLink1Description: https://datasheet.ciiva.com/15189/getdatasheetpartid-348154-15189885.pdf?src-supplier=Verical; ComponentLink2URL: https://datasheet.ciiva.com/17042/rc0805-17042698.pdf?src-supplier=Future+Electronics; ComponentLink2Description: https://datasheet.ciiva.com/17042/rc0805-17042698.pdf?src-supplier=Future+Electronics; Supplier Part Number 1: RC0805FR-070RL; LCSC Part Number: C100045
R85 = HoCUH2512-3W-200KR-1%: 3W ±1% 200kΩ 2512 Chip Resistor - Surface Mount ROHS; Manufacturer: Milliohm; Manufacturer Part Number: HoCUH2512-3W-200KR-1%; Package: 2512; ComponentLink1Description: LCSC; ComponentLink1URL: https://www.lcsc.com/product-detail/Chip-Resistor-Surface-Mount_Milliohm-HoCUH2512-3W-200KR-1_C5123645.html; LCSC Part Number: C5123645; Item Type: Resistor
R86 = RC2512JK-7W6K2L: RES 6.2K OHM 5% 2W 2512; Manufacturer: Yageo; Item Type: Resistors; Supplier: Digikey; LCSC Part Number: C136991; Manufacturer Part Number: RC2512JK-7W6K2L; RoHS: Yes; Pricing: 4000=0.07843 (USD)
R88 = RC0603FR-07220RL: RES SMD 220 OHM 1% 1/10W 0603; Manufacturer: Yageo; Temperature Coefficient: 100ppm/°C; Voltage Rating (DC): 50V; Power Rating: 100mW; Item Type: Resistor; Supplier 1: Digi-Key; Manufacturer Part Number: RC0603FR-07220RL; Stock 1: 5843995; Pricing 1: 1=0.1, 10=0.023, 100=0.0094, 1000=0.00421, 2500=0.00366 (USD); Case/Package: 0603; Number of Pins: 2; Case Code (Imperial): 0603; Case Code (Metric): 1608; Min Operating Temperature: -55°C; Max Operating Temperature: 155°C; Resistance: 220R; Tolerance: 1%; Composition: Thick Film; Packaging: Tape and Reel; Voltage Rating: 50V; Package Quantity: 1; Termination: SMD/SMT; Number of Terminations: 2; Military Standard: Not; Max Power Dissipation: 100mW; Features: Moisture Resistant; Length: 1.6mm; Height: 0.022inch; Width: 0.031inch; Depth: 0.8mm; REACH SVHC: No SVHC; Lead Free: Lead Free; ComponentLink1URL: http://www.yageo.com/documents/recent/PYu-RC_Group_51_RoHS_L_10.pdf?src-supplier=Digi-Key; ComponentLink1Description: http://www.yageo.com/documents/recent/PYu-RC_Group_51_RoHS_L_10.pdf?src-supplier=Digi-Key; ComponentLink2URL: http://www.farnell.com/datasheets/1868787.pdf?src-supplier=Element14; ComponentLink2Description: http://www.farnell.com/datasheets/1868787.pdf?src-supplier=Element14; Supplier Part Number 1: 311-220HRCT-ND; LCSC Part Number: C107696
R89 R90 = RC0402FR-0710KL: RES 10K OHM 1% 1/16W 0402; Manufacturer: Yageo; Temperature Coefficient: 100ppm/°C; Working Voltage: 50V; Item Type: Resistor; Resistance: 10kR; Power Rating: 62.5mW; Max Power Dissipation: 63mW; Supplier 1: Mouser; Manufacturer Part Number: RC0402FR-0710KL; RoHS: Yes; Category: Chip SMD Resistors; Stock 1: 18648329; Pricing 1: 1=0.10000, 10=0.01400, 50=0.01400, 100=0.00500, 1000=0.00300, 10000=0.00200 (USD); Case/Package: 0402; Min Operating Temperature: -55°C; Max Operating Temperature: 155°C; Tolerance: 1%; Resistor Type: Thick Film; Construction: Rectangular; Packaging: Tape and Reel; Termination: SMD/SMT; RoHS Compliant: Yes; ComponentLink1URL: https://datasheet.ciiva.com/7660/38568-7660787.pdf?src-supplier=Element14; ComponentLink1Description: https://datasheet.ciiva.com/7660/38568-7660787.pdf?src-supplier=Element14; ComponentLink2URL: https://datasheet.ciiva.com/7849/1686128-7849814.pdf?src-supplier=Element14; ComponentLink2Description: https://datasheet.ciiva.com/7849/1686128-7849814.pdf?src-supplier=Element14; ComponentLink3URL: https://datasheet.ciiva.com/7983/1018594-7983486.pdf?src-supplier=Element14; ComponentLink3Description: https://datasheet.ciiva.com/7983/1018594-7983486.pdf?src-supplier=Element14; Supplier Part Number 1: 603-RC0402FR-0710KL; LCSC Part Number: C60490; Number of Pins: 2; Case Code (Imperial): 0402; Case Code (Metric): 1005; Voltage Rating (DC): 50V; Voltage Rating: 50V; Number of Terminations: 2; Features: Moisture Resistant; Series: RC; Resistance Tolerance: 1%; Length: 1mm; Width: 0.5mm; Height: 0.32mm; Depth: 0.5mm; Lead Pitch: 0.2mm; REACH SVHC: No SVHC; Lead Free: Lead Free; Military Standard: Not; ComponentLink4URL: https://datasheet.ciiva.com/22747/1018594-22747512.pdf?src-supplier=Element14; ComponentLink4Description: https://datasheet.ciiva.com/22747/1018594-22747512.pdf?src-supplier=Element14; ComponentLink5URL: https://datasheet.ciiva.com/12667/pyu-rc0402-51-rohs-l-6-r-12667067.pdf?src-supplier=Mouser; ComponentLink5Description: https://datasheet.ciiva.com/12667/pyu-rc0402-51-rohs-l-6-r-12667067.pdf?src-supplier=Mouser; ComponentLink6URL: https://datasheet.ciiva.com/7849/1784430-7849813.pdf?src-supplier=Element14; ComponentLink6Description: https://datasheet.ciiva.com/7849/1784430-7849813.pdf?src-supplier=Element14; ComponentLink7URL: https://datasheet.ciiva.com/7849/1784430-7849815.pdf?src-supplier=Element14; ComponentLink7Description: https://datasheet.ciiva.com/7849/1784430-7849815.pdf?src-supplier=Element14
U13 = ADS1115IDGSR: IC ADC 16BIT SIGMA-DELTA 10VSSOP; Manufacturer: Texas Instruments; Interface: I2C; Number of Bits: 16; Sampling Rate: 860S/s; Number of A/D Converters: 1; Resolution: 16b; Polarity: Bipolar; Min Supply Voltage: 2V; Max Supply Voltage: 5.5V; Supply Type: Single; Conversion Rate: 0.86KS/s; Number of Inputs: 4; Integral Nonlinearity (INL): 1LSB; Power Dissipation: 900uW; Nominal Supply Current: 150uA; Number of Channels: 2; Supplier: Mouser; Supplier Part Number: 595-ADS1115IDGSR; Manufacturer Part Number: ADS1115IDGSR; RoHS: Yes; Category: Analog to Digital Converters (ADCs); Stock: 5925; Pricing: 1=5.44, 10=4.76, 50=4.76, 100=4.01, 1000=2.88, 10000=2.78 (USD); Case/Package: VSSOP; Pins: 10; Contact Plating: Gold; Min Operating Temperature: -40°C; Max Operating Temperature: 125°C; Package Quantity: 2500; Packaging: Tape and Reel; Number of Converters: 1; Max Supply Voltage (DC): 5.5V; Min Supply Voltage (DC): 2V; Series: -; Length: 3mm; Width: 3mm; Height: 1.07mm; Thickness: 1.02mm; Reach SVHC Compliant: No; Lead Free: Lead Free; RoHS Compliant: Yes; ComponentLink1URL: https://datasheet.ciiva.com/4031/47725463s8438921n7713-4031028.pdf?src-supplier=Arrow+Electronics; ComponentLink1Description: https://datasheet.ciiva.com/4031/47725463s8438921n7713-4031028.pdf?src-supplier=Arrow+Electronics; LCSC Part Number: C37593; Item Type: IC
U14 = TLI4971-A120T5-U-E0001: POSITION&CURRENT SENSORS; Manufacturer: Infineon; Accuracy: 2.25%; Max Supply Voltage: 3.5V; Min Supply Voltage: 3.1V; Operating Supply Current: 15mA; Sensing Method: 6244SensingMethod; Supplier: Arrow Electronics; LCSC Part Number: C540236; Manufacturer Part Number: TLI4971-A120T5-U-E0001; RoHS: Yes; Item Type: Current Sensors; Stock: 5000; Pricing: 2500=2.753 (USD); Height: 1.1mm

## Sheet Connector-Sheet.SchDoc
size 420 x 297 mm; SheetNumber: 8; SheetTotal: 9
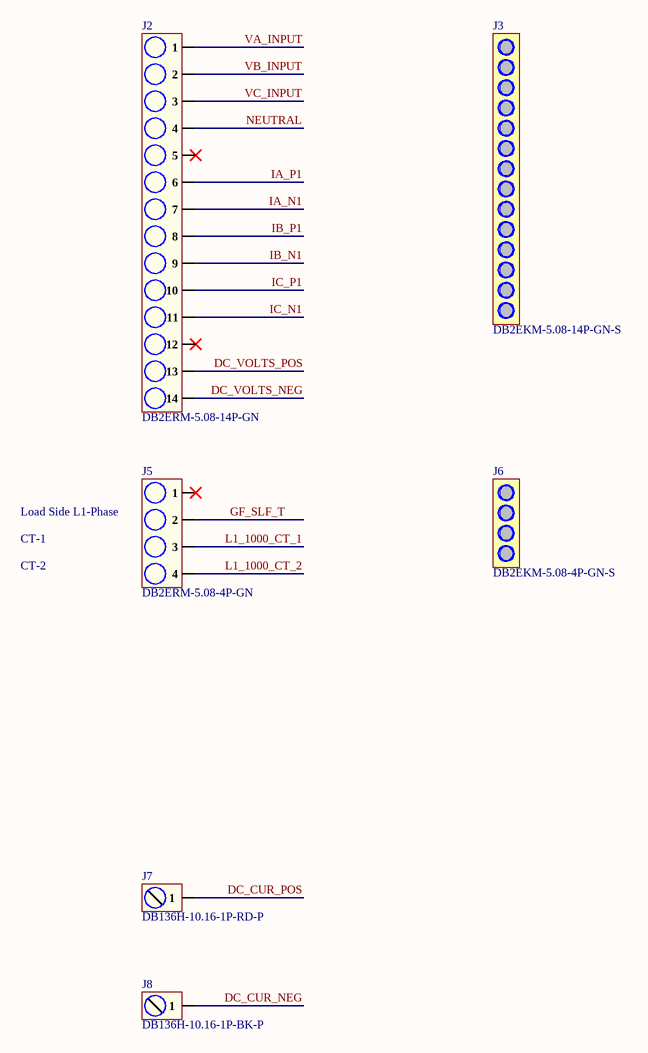
[diagram p7: Connector-Sheet.SchDoc]

### Parts
J2  DB2ERM-5.08-14P-GN  [DB2ERM-5.08-14P-GN]
J3  DB2EKM-5.08-14P-GN-S  (mechanical)
J5  DB2ERM-5.08-4P-GN  [DB2ERM-5.08-4P-GN]
J6  DB2EKM-5.08-4P-GN-S  (mechanical)
J7  DB136H-10.16-1P-RD-P  [DB136H-10.16-1P-RD-P]
J8  DB136H-10.16-1P-BK-P  [DB136H-10.16-1P-BK-P]

### Nets
DC_CUR_NEG: J8.1
DC_CUR_POS: J7.1
DC_VOLTS_NEG: J2.14
DC_VOLTS_POS: J2.13
GF_SLF_T: J5.2
IA_N1: J2.7
IA_P1: J2.6
IB_N1: J2.9
IB_P1: J2.8
IC_N1: J2.11
IC_P1: J2.10
L1_1000_CT_1: J5.3
L1_1000_CT_2: J5.4
NEUTRAL: J2.4
VA_INPUT: J2.1
VB_INPUT: J2.2
VC_INPUT: J2.3

Not connected (* = marked no-connect by the designer): J2 5* 12*; J5 1*

### Notes on the sheet
- (near J5) Load Side L1-Phase
- CT-1
- CT-2
- ZyntelliTech
- File:
- Title:
- Date:
- Page
- Num:
- Total:
- Drawn By: Huzaifa Ali

### Library data of the parts
J2 = DB2ERM-5.08-14P-GN: 320V 20A 14 Bend -40℃~+105℃ 1 5.08mm 1x14P Green Receptacle-Close Screw Fixing Push-Pull,P=5.08mm Pluggable System Terminal Block ROHS; Manufacturer: DORABO; Manufacturer Part Number: DB2ERM-5.08-14P-GN; Package: Push-Pull,P=5.08mm; LCSC Part Number: C430534; Item Type: Terminal Block; ComponentLink1Description: LCSC; ComponentLink1URL: https://www.lcsc.com/product-detail/Pluggable-System-Terminal-Block_DORABO-DB2ERM-5-08-14P-GN_C430534.html?s_z=n_DB2ERM-5.08-14P-GN
J3 = DB2EKM-5.08-14P-GN-S: -40℃~+105℃ 2.5 1 14~28 5.08mm 320V 20A 14 1x14P Green Plug Screw Fixing P=5.08mm Pluggable System Terminal Block ROHS; Manufacturer: DORABO; Manufacturer Part Number: DB2EKM-5.08-14P-GN-S; Package: P=5.08mm; LCSC Part Number: C430521; Item Type: Terminal Block; ComponentLink1Description: LCSC; ComponentLink1URL: https://www.lcsc.com/product-detail/Pluggable-System-Terminal-Block_DORABO-DB2EKM-5-08-14P-GN-S_C430521.html?s_z=n_DB2EKM-5.08-14P-GN-S
J5 = DB2ERM-5.08-4P-GN: 320V 20A 4 Bend -40℃~+105℃ 1 5.08mm 1x4P Green Receptacle-Close Screw Fixing Push-Pull,P=5.08mm Pluggable System Terminal Block ROHS; Manufacturer: DORABO; Manufacturer Part Number: DB2ERM-5.08-4P-GN; Package: Push-Pull,P=5.08mm; LCSC Part Number: C395755; Item Type: Terminal Block; ComponentLink1Description: LCSC; ComponentLink1URL: https://www.lcsc.com/product-detail/Pluggable-System-Terminal-Block_DORABO-DB2ERM-5-08-4P-GN_C395755.html?s_z=n_DB2ERM-5.08-4P-GN
J6 = DB2EKM-5.08-4P-GN-S: -40℃~+105℃ 2.5 1 14~28 5.08mm 320V 20A 4 1x4P Green Plug Screw Fixing P=5.08mm Pluggable System Terminal Block ROHS; Manufacturer: DORABO; Manufacturer Part Number: DB2EKM-5.08-4P-GN-S; Package: P=5.08mm; LCSC Part Number: C395756; Item Type: Terminal Block; ComponentLink1Description: LCSC; ComponentLink1URL: https://www.lcsc.com/product-detail/Pluggable-System-Terminal-Block_DORABO-DB2EKM-5-08-4P-GN-S_C395756.html?s_z=n_DB2EKM-5.08-4P-GN-S
J7 = DB136H-10.16-1P-RD-P: 1000V 57A 1 1 10.16mm P=10.16mm Pluggable System Terminal Block ROHS; Manufacturer: DORABO; Manufacturer Part Number: DB136H-10.16-1P-RD-P; Package: P=10.16mm; LCSC Part Number: C5445315; Item Type: Terminal Block; ComponentLink1Description: LCSC; ComponentLink1URL: https://www.lcsc.com/product-detail/Pluggable-System-Terminal-Block_DORABO-DB136H-10-16-1P-RD-P_C5445315.html
J8 = DB136H-10.16-1P-BK-P: 1000V 57A 1 1 10.16mm P=10.16mm Pluggable System Terminal Block ROHS; Manufacturer: DORABO; Manufacturer Part Number: DB136H-10.16-1P-BK-P; Package: P=10.16mm; LCSC Part Number: C5445314; Item Type: Terminal Block; ComponentLink1Description: LCSC; ComponentLink1URL: https://www.lcsc.com/product-detail/Pluggable-System-Terminal-Block_DORABO-DB136H-10-16-1P-BK-P_C5445314.html

## Sheet Ground-Fault-Detect-Sheet-3.SchDoc
size 420 x 297 mm; SheetNumber: 9; SheetTotal: 9
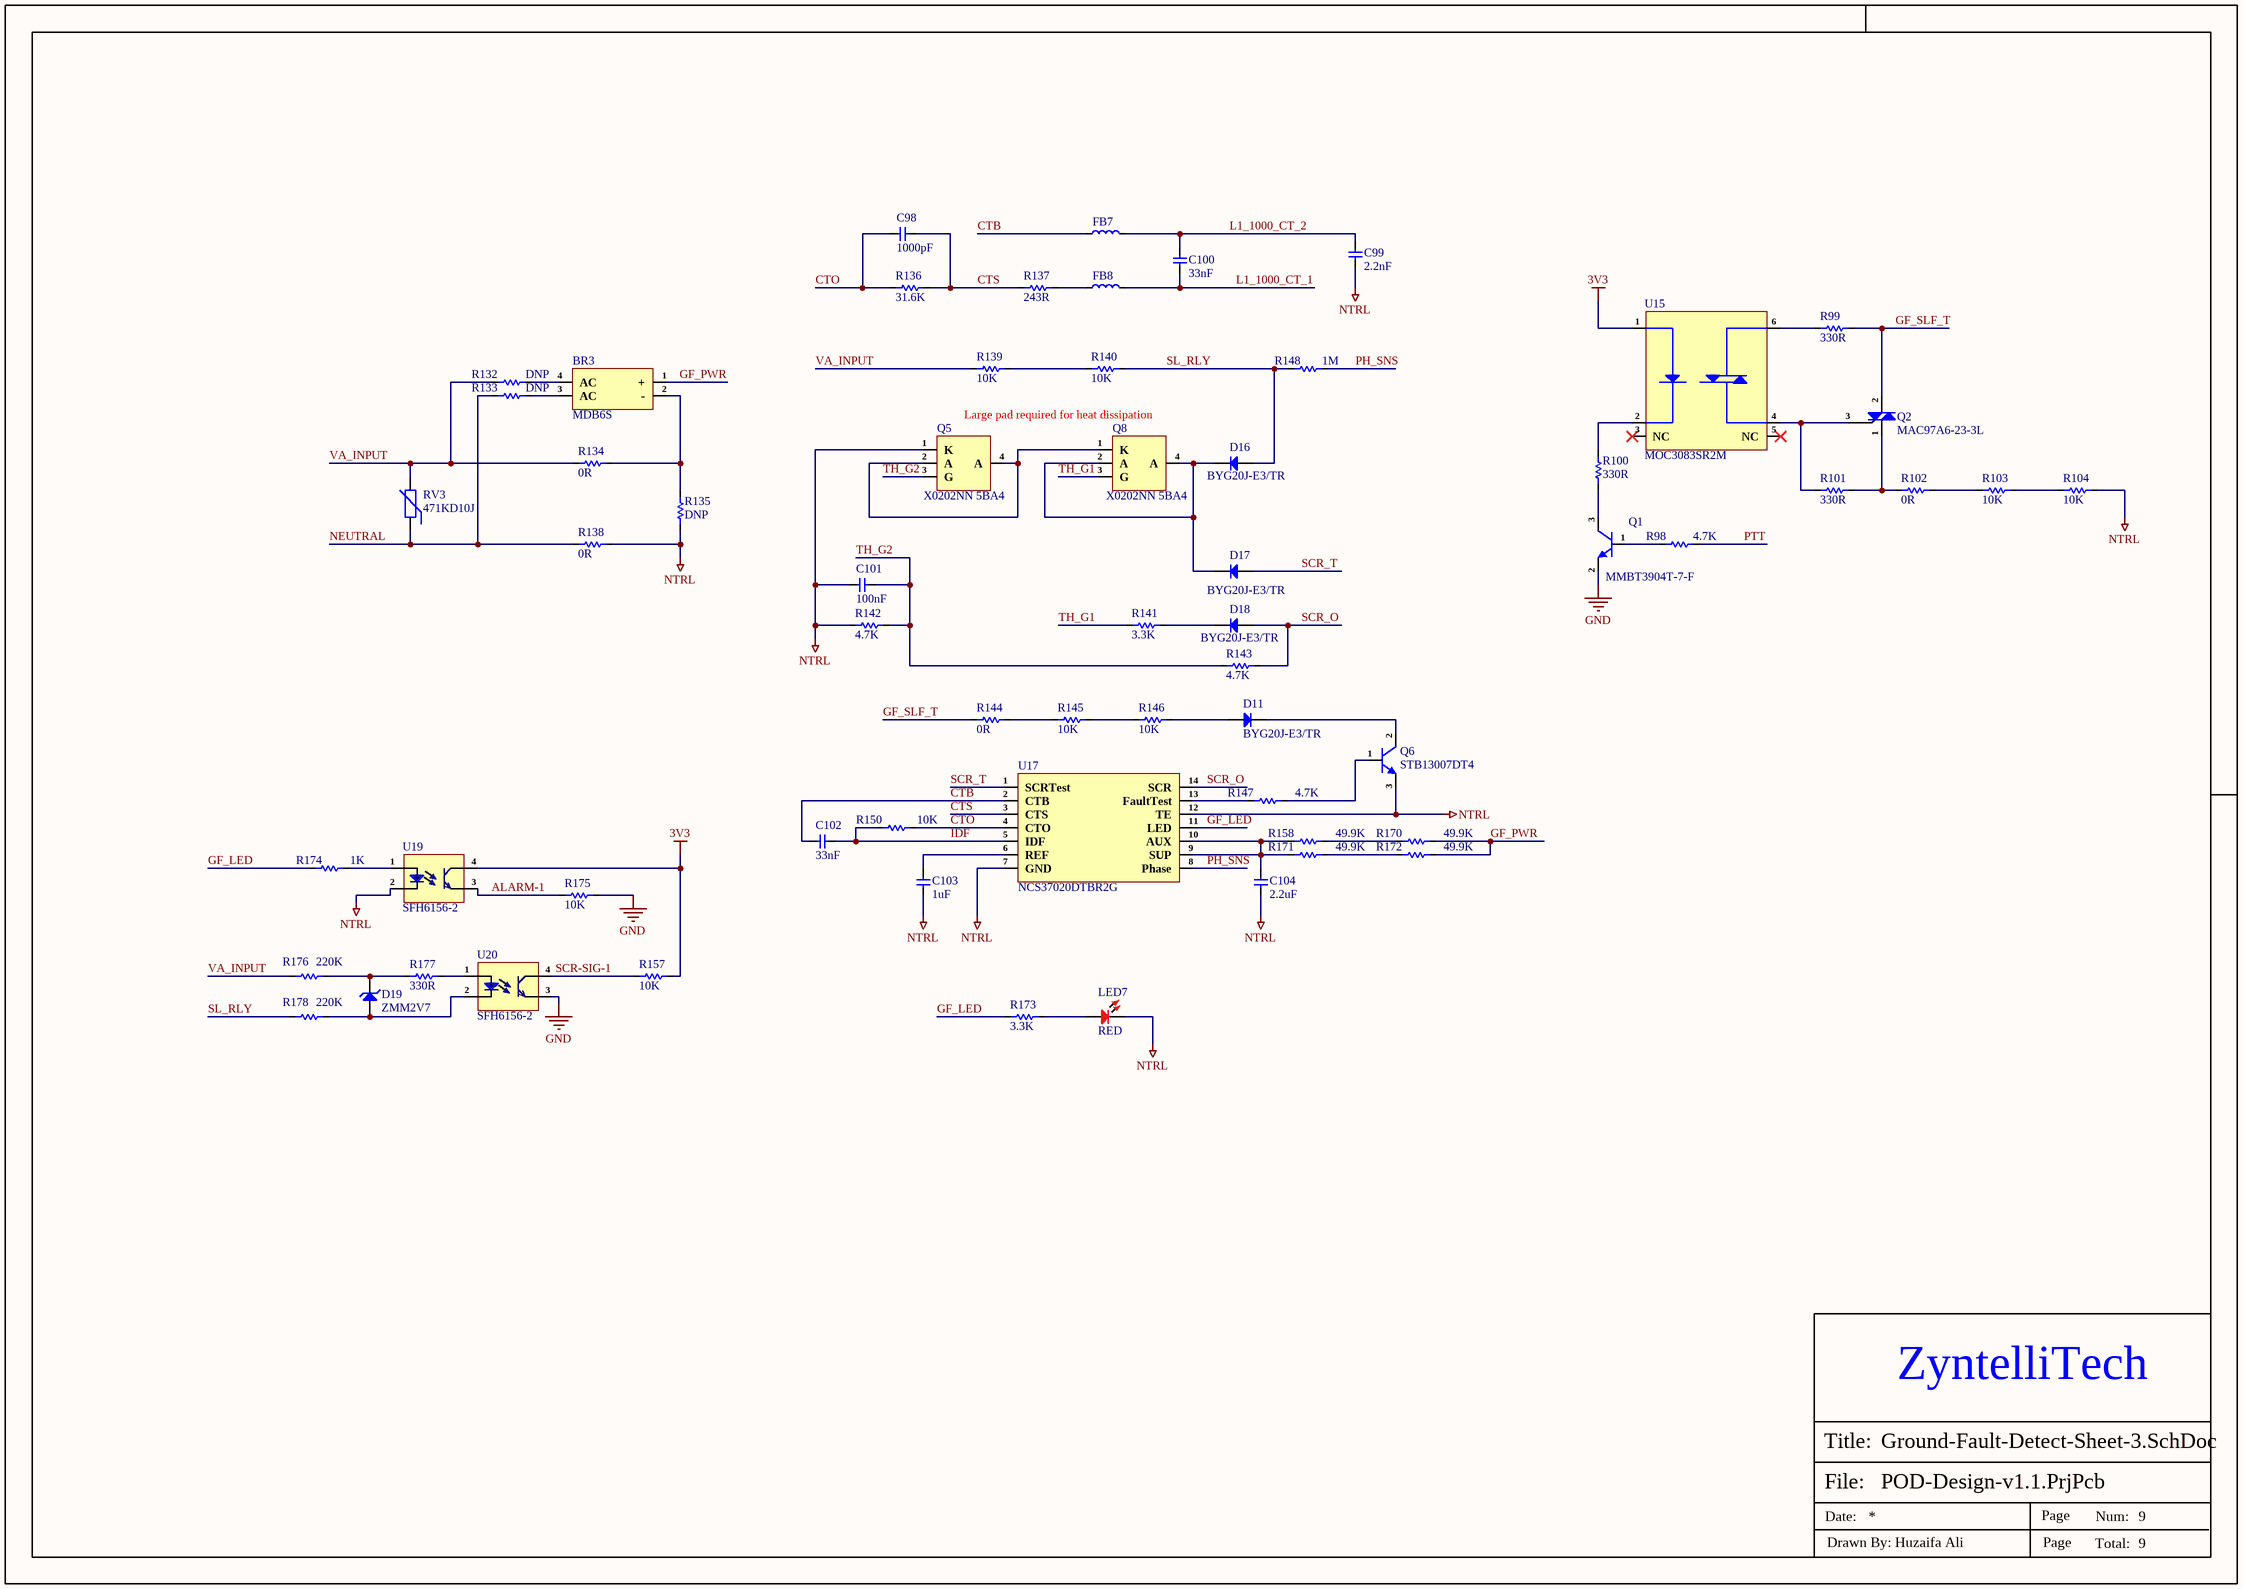
[diagram p8: Ground-Fault-Detect-Sheet-3.SchDoc]

### Parts
BR3  MDB6S  [TSSOP-4(5.0x4.4)]
C98  1000pF  [Cap-0603]
C99  2.2nF  [Cap-0603]
C100  33nF  [Cap-0603]
C101  100nF  [cap-0402]
C102  33nF  [Cap-0603]
C103  1uF  [Cap-0603]
C104  2.2uF  [Cap-0805]
D11  BYG20J-E3/TR  [SMA(DO-214AC)]
D16  BYG20J-E3/TR  [SMA(DO-214AC)]
D17  BYG20J-E3/TR  [SMA(DO-214AC)]
D18  BYG20J-E3/TR  [SMA(DO-214AC)]
D19  ZMM2V7  [LL-34]
FB7  BLM18HE102SN1D  [IND-0603 (1608 Metric)]  (value not drawn)
FB8  BLM18HE102SN1D  [IND-0603 (1608 Metric)]  (value not drawn)
LED7  RED  [LED-0603]
Q1  MMBT3904T-7-F  [SOT-523]
Q2  MAC97A6-23-3L  [SOT-23]
Q5  X0202NN 5BA4  [SOT- 223]
Q6  STB13007DT4  [D2PAK]
Q8  X0202NN 5BA4  [SOT- 223]
R98  4.7K  [Res-0603]
R99  330R  [Res-1206]
R100  330R  [Res-1206]
R101  330R  [Res-1206]
R102  0R  [RES-2512]
R103  10K  [RES-2512]
R104  10K  [RES-2512]
R132  DNP  [Res-0805]
R133  DNP  [Res-0805]
R134  0R  [Res-0805]
R135  DNP  [Res-0805]
R136  31.6K  [Res-1206]
R137  243R  [Res-1206]
R138  0R  [Res-0805]
R139  10K  [RES-2512]
R140  10K  [RES-2512]
R141  3.3K  [Res-0603]
R142  4.7K  [Res-0402]
R143  4.7K  [Res-0402]
R144  0R  [RES-2512]
R145  10K  [RES-2512]
R146  10K  [RES-2512]
R147  4.7K  [Res-0402]
R148  1M  [RES-2010]
R150  10K  [Res-0603]
R157  10K  [Res-0402]
R158  49.9K  [Res-1206]
R170  49.9K  [Res-1206]
R171  49.9K  [Res-1206]
R172  49.9K  [Res-1206]
R173  3.3K  [Res-0603]
R174  1K  [Res-0603]
R175  10K  [Res-0402]
R176  220K  [Res-1206]
R177  330R  [Res-1206]
R178  220K  [Res-1206]
RV3  471KD10J  [471KD10J]
U15  MOC3083SR2M  [SMD-6P]
U17  NCS37020DTBR2G  [14-TSSOP]
U19  SFH6156-2  [SFH6156-2]
U20  SFH6156-2  [SFH6156-2]

### Nets
3V3: R157.1 U15.1 U19.4(C)
GND: Q1.2(E) R175.1 U20.3(E)
NTRL: C99.1 C101.1 C103.1 C104.1 LED7.2 Q5.1(K) Q6.3(E) R104.2 R135.1 R138.2 R142.1 U17.7(GND) U17.12(TE) U19.2(Ca)
ALARM-1: R175.2 U19.3(E)
CTB: C102.2 FB7.1 U17.2(CTB)
CTO: C98.1 R136.1 R150.2 U17.4(CTO)
CTS: C98.2 R136.2 R137.1 U17.3(CTS)
GF_LED: R173.1 R174.1 U17.11(LED)
GF_PWR: BR3.1(+) R170.2 R172.2
GF_SLF_T: Q2.2(T2) R99.2 R144.1
IDF: C102.1 R150.1 U17.5(IDF)
L1_1000_CT_1: C100.2 FB8.2
L1_1000_CT_2: C99.2 C100.1 FB7.2
NEUTRAL: R133.1 R138.1 RV3.1
PH_SNS: R148.2 U17.8(Phase)
PTT: R98.2
SCR-SIG-1: R157.2 U20.4(C)
SCR_O: D18.2(A) R143.2 U17.14(SCR)
SCR_T: D17.2(A) U17.1(SCRTest)
SL_RLY: D16.2(A) R140.2 R148.1 R178.2
TH_G1: Q8.3(G) R141.2
TH_G2: C101.2 Q5.3(G) R142.2 R143.1
VA_INPUT: R132.1 R134.1 R139.1 R176.2 RV3.2
NetBR3_2: BR3.2(-) R134.2 R135.2
NetBR3_3: BR3.3(AC) R133.2
NetBR3_4: BR3.4(AC) R132.2
NetC103_2: C103.2 U17.6(REF)
NetC104_2: C104.2 R158.1 R171.1 U17.9(SUP) U17.10(AUX)
NetD11_1: D11.1(K) Q6.2(C)
NetD11_2: D11.2(A) R146.2
NetD16_1: D16.1(K) D17.1(K) Q8.2(A) Q8.4(A)
NetD18_1: D18.1(K) R141.1
NetD19_1: D19.1(K) R176.1 R177.1
NetD19_2: D19.2(A) R178.1 U20.2(Ca)
NetFB8_1: FB8.1 R137.2
NetLED7_1: LED7.1 R173.2
NetQ1_1: Q1.1(B) R98.1
NetQ1_3: Q1.3(C) R100.1
NetQ2_1: Q2.1(T1) R101.2 R102.1
NetQ2_3: Q2.3(G) R101.1 U15.4
NetQ5_2: Q5.2(A) Q5.4(A) Q8.1(K)
NetQ6_1: Q6.1(B) R147.2
NetR99_1: R99.1 U15.6
NetR100_2: R100.2 U15.2
NetR102_2: R102.2 R103.1
NetR103_2: R103.2 R104.1
NetR139_2: R139.2 R140.1
NetR144_2: R144.2 R145.1
NetR145_2: R145.2 R146.1
NetR147_1: R147.1 U17.13(FaultTest)
NetR158_2: R158.2 R170.1
NetR171_2: R171.2 R172.1
NetR174_2: R174.2 U19.1(An)
NetR177_2: R177.2 U20.1(An)

Not connected (* = marked no-connect by the designer): U15 3(NC)* 5(NC)*

### Notes on the sheet
- Large pad required for heat dissipation
- ZyntelliTech
- File:
- Title:
- Date:
- Page
- Num:
- Total:
- Drawn By: Huzaifa Ali